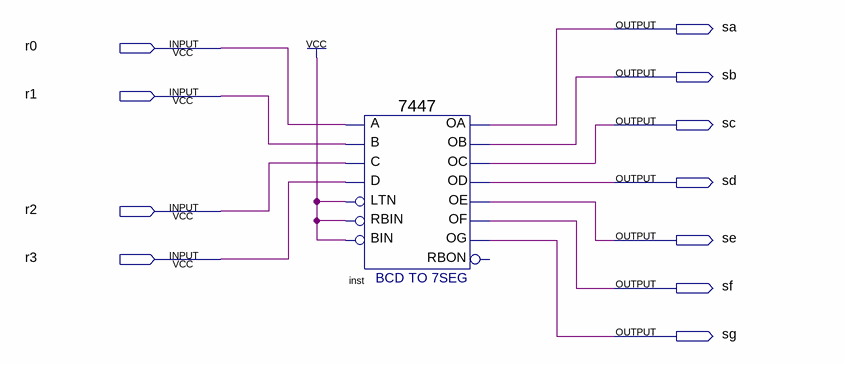
[diagram p0: schematic sheet]
// Quartus schematic display.bdf as structural Verilog: 1 symbols, 11 pins
module display (
  input  r0,
  input  r1,
  input  r2,
  input  r3,
  output sa,
  output sb,
  output sc,
  output sd,
  output se,
  output sf,
  output sg
);

  \7447  inst (
    .LTN(1'b1), .B(r1), .C(r2), .D(r3), .RBIN(1'b1), .BIN(1'b1), .A(r0), .OB(sb), .OC(sc), .OE(se), .OD(sd),
    .OF(sf), .OG(sg), .OA(sa));  // open: RBON
endmodule
